# Altium schematic sheet 03_SoC_Power.SchDoc
size A3; SheetNumber: 13; SheetTotal: 21
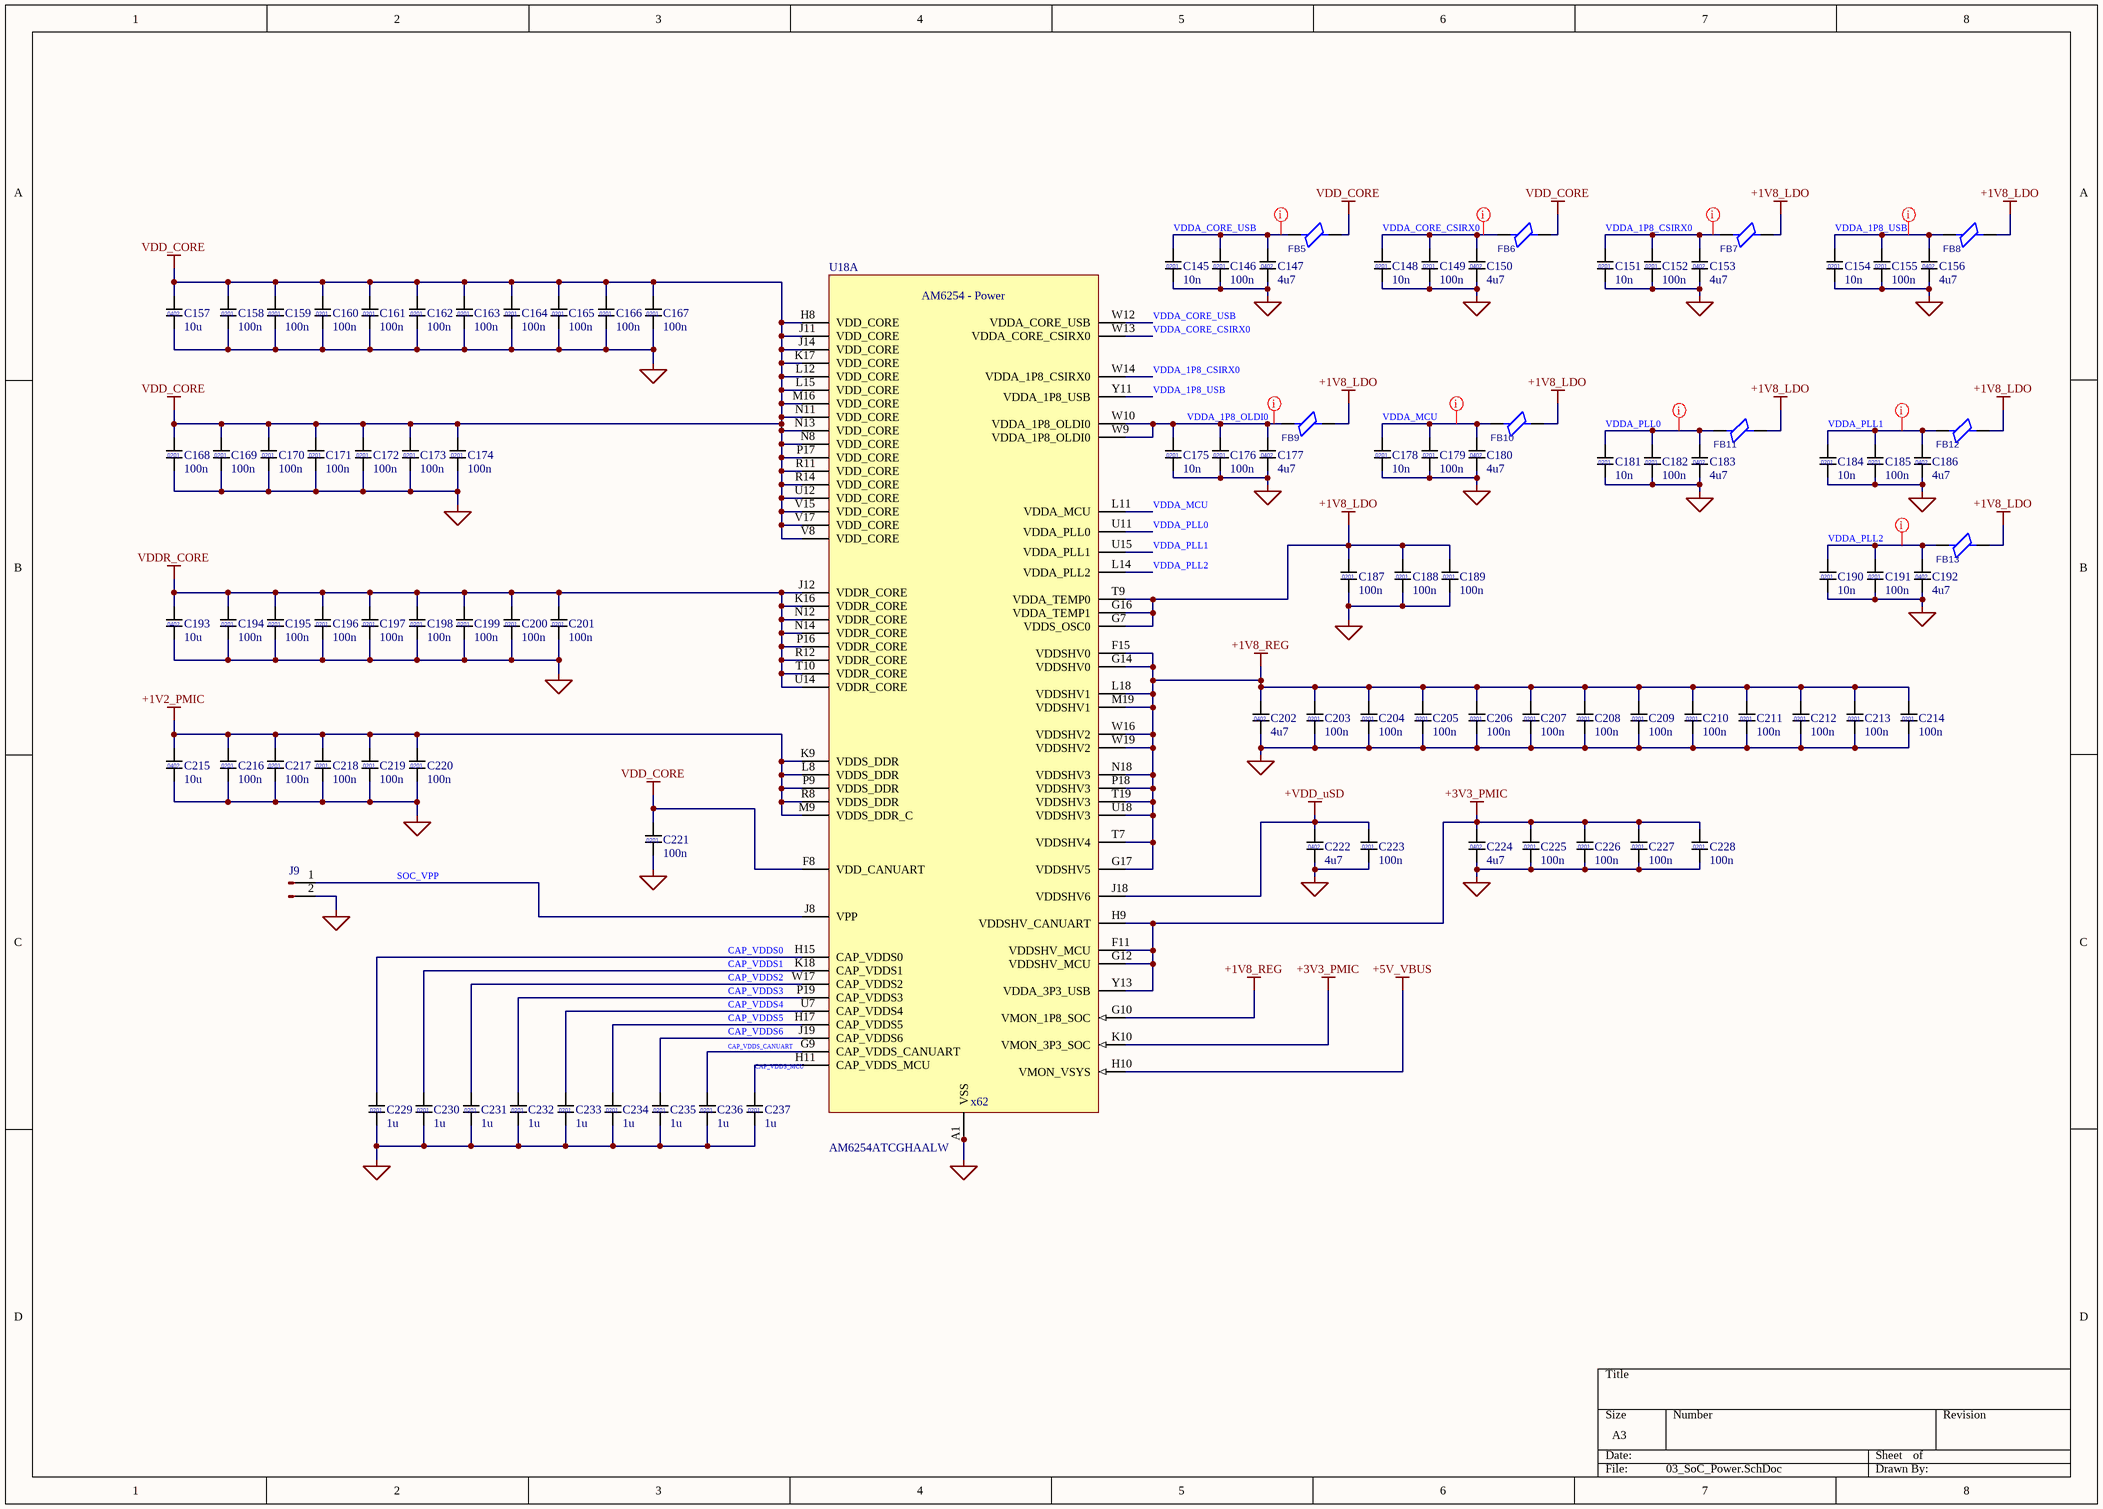
[diagram p0: 03_SoC_Power.SchDoc]

## Parts
C145  value 10n  [C0201]  (hidden comment: C_0201)
C146  value 100n  [C0201]  (hidden comment: C_0201)
C147  4u7  [C0402]
C148  value 10n  [C0201]  (hidden comment: C_0201)
C149  value 100n  [C0201]  (hidden comment: C_0201)
C150  4u7  [C0402]
C151  value 10n  [C0201]  (hidden comment: C_0201)
C152  value 100n  [C0201]  (hidden comment: C_0201)
C153  4u7  [C0402]
C154  value 10n  [C0201]  (hidden comment: C_0201)
C155  value 100n  [C0201]  (hidden comment: C_0201)
C156  4u7  [C0402]
C157  value 10u  [C0402]  (hidden comment: 4u7)
C158  value 100n  [C0201]  (hidden comment: C_0201)
C159  value 100n  [C0201]  (hidden comment: C_0201)
C160  value 100n  [C0201]  (hidden comment: C_0201)
C161  value 100n  [C0201]  (hidden comment: C_0201)
C162  value 100n  [C0201]  (hidden comment: C_0201)
C163  value 100n  [C0201]  (hidden comment: C_0201)
C164  value 100n  [C0201]  (hidden comment: C_0201)
C165  value 100n  [C0201]  (hidden comment: C_0201)
C166  value 100n  [C0201]  (hidden comment: C_0201)
C167  value 100n  [C0201]  (hidden comment: C_0201)
C168  value 100n  [C0201]  (hidden comment: C_0201)
C169  value 100n  [C0201]  (hidden comment: C_0201)
C170  value 100n  [C0201]  (hidden comment: C_0201)
C171  value 100n  [C0201]  (hidden comment: C_0201)
C172  value 100n  [C0201]  (hidden comment: C_0201)
C173  value 100n  [C0201]  (hidden comment: C_0201)
C174  value 100n  [C0201]  (hidden comment: C_0201)
C175  value 10n  [C0201]  (hidden comment: C_0201)
C176  value 100n  [C0201]  (hidden comment: C_0201)
C177  4u7  [C0402]
C178  value 10n  [C0201]  (hidden comment: C_0201)
C179  value 100n  [C0201]  (hidden comment: C_0201)
C180  4u7  [C0402]
C181  value 10n  [C0201]  (hidden comment: C_0201)
C182  value 100n  [C0201]  (hidden comment: C_0201)
C183  4u7  [C0402]
C184  value 10n  [C0201]  (hidden comment: C_0201)
C185  value 100n  [C0201]  (hidden comment: C_0201)
C186  4u7  [C0402]
C187  value 100n  [C0201]  (hidden comment: C_0201)
C188  value 100n  [C0201]  (hidden comment: C_0201)
C189  value 100n  [C0201]  (hidden comment: C_0201)
C190  value 10n  [C0201]  (hidden comment: C_0201)
C191  value 100n  [C0201]  (hidden comment: C_0201)
C192  4u7  [C0402]
C193  value 10u  [C0402]  (hidden comment: 4u7)
C194  value 100n  [C0201]  (hidden comment: C_0201)
C195  value 100n  [C0201]  (hidden comment: C_0201)
C196  value 100n  [C0201]  (hidden comment: C_0201)
C197  value 100n  [C0201]  (hidden comment: C_0201)
C198  value 100n  [C0201]  (hidden comment: C_0201)
C199  value 100n  [C0201]  (hidden comment: C_0201)
C200  value 100n  [C0201]  (hidden comment: C_0201)
C201  value 100n  [C0201]  (hidden comment: C_0201)
C202  4u7  [C0402]
C203  value 100n  [C0201]  (hidden comment: C_0201)
C204  value 100n  [C0201]  (hidden comment: C_0201)
C205  value 100n  [C0201]  (hidden comment: C_0201)
C206  value 100n  [C0201]  (hidden comment: C_0201)
C207  value 100n  [C0201]  (hidden comment: C_0201)
C208  value 100n  [C0201]  (hidden comment: C_0201)
C209  value 100n  [C0201]  (hidden comment: C_0201)
C210  value 100n  [C0201]  (hidden comment: C_0201)
C211  value 100n  [C0201]  (hidden comment: C_0201)
C212  value 100n  [C0201]  (hidden comment: C_0201)
C213  value 100n  [C0201]  (hidden comment: C_0201)
C214  value 100n  [C0201]  (hidden comment: C_0201)
C215  value 10u  [C0402]  (hidden comment: 4u7)
C216  value 100n  [C0201]  (hidden comment: C_0201)
C217  value 100n  [C0201]  (hidden comment: C_0201)
C218  value 100n  [C0201]  (hidden comment: C_0201)
C219  value 100n  [C0201]  (hidden comment: C_0201)
C220  value 100n  [C0201]  (hidden comment: C_0201)
C221  value 100n  [C0201]  (hidden comment: C_0201)
C222  4u7  [C0402]
C223  value 100n  [C0201]  (hidden comment: C_0201)
C224  4u7  [C0402]
C225  value 100n  [C0201]  (hidden comment: C_0201)
C226  value 100n  [C0201]  (hidden comment: C_0201)
C227  value 100n  [C0201]  (hidden comment: C_0201)
C228  value 100n  [C0201]  (hidden comment: C_0201)
C229  value 1u  [C0201]  (hidden comment: C_0201)
C230  value 1u  [C0201]  (hidden comment: C_0201)
C231  value 1u  [C0201]  (hidden comment: C_0201)
C232  value 1u  [C0201]  (hidden comment: C_0201)
C233  value 1u  [C0201]  (hidden comment: C_0201)
C234  value 1u  [C0201]  (hidden comment: C_0201)
C235  value 1u  [C0201]  (hidden comment: C_0201)
C236  value 1u  [C0201]  (hidden comment: C_0201)
C237  value 1u  [C0201]  (hidden comment: C_0201)
FB5  FB_0402  [FB0402]  (value not drawn)
FB6  FB_0402  [FB0402]  (value not drawn)
FB7  FB_0402  [FB0402]  (value not drawn)
FB8  FB_0402  [FB0402]  (value not drawn)
FB9  FB_0402  [FB0402]  (value not drawn)
FB10  FB_0402  [FB0402]  (value not drawn)
FB11  FB_0402  [FB0402]  (value not drawn)
FB12  FB_0402  [FB0402]  (value not drawn)
FB13  FB_0402  [FB0402]  (value not drawn)
J9  Conn_01x02_Pin  (value not drawn)
U18  AM6254ATCGHAALW  [AM6254ATCGHAALW]  (part A of 15)

## Nets
+1V2_PMIC: C215.1 C216.1 C217.1 C218.1 C219.1 C220.1 U18.K9(VDDS_DDR) U18.L8(VDDS_DDR) U18.M9(VDDS_DDR_C) U18.P9(VDDS_DDR) U18.R8(VDDS_DDR)
+1V8_LDO: C187.1 C188.1 C189.1 FB7.2 FB8.2 FB9.2 FB10.2 FB11.2 FB12.2 FB13.2 U18.G7(VDDS_OSC0) U18.G16(VDDA_TEMP1) U18.T9(VDDA_TEMP0)
+1V8_REG: C202.1 C203.1 C204.1 C205.1 C206.1 C207.1 C208.1 C209.1 C210.1 C211.1 C212.1 C213.1 C214.1 U18.F15(VDDSHV0) U18.G10(VMON_1P8_SOC) U18.G14(VDDSHV0) U18.G17(VDDSHV5) U18.L18(VDDSHV1) U18.M19(VDDSHV1) U18.N18(VDDSHV3) U18.P18(VDDSHV3) U18.T7(VDDSHV4) U18.T19(VDDSHV3) U18.U18(VDDSHV3) U18.W16(VDDSHV2) U18.W19(VDDSHV2)
+3V3_PMIC: C224.1 C225.1 C226.1 C227.1 C228.1 U18.F11(VDDSHV_MCU) U18.G12(VDDSHV_MCU) U18.H9(VDDSHV_CANUART) U18.K10(VMON_3P3_SOC) U18.Y13(VDDA_3P3_USB)
+5V_VBUS: U18.H10(VMON_VSYS)
+VDD_uSD: C222.1 C223.1 U18.J18(VDDSHV6)
GND: C145.2 C146.2 C147.2 C148.2 C149.2 C150.2 C151.2 C152.2 C153.2 C154.2 C155.2 C156.2 C157.2 C158.2 C159.2 C160.2 C161.2 C162.2 C163.2 C164.2 C165.2 C166.2 C167.2 C168.2 C169.2 C170.2 C171.2 C172.2 C173.2 C174.2 C175.2 C176.2 C177.2 C178.2 C179.2 C180.2 C181.2 C182.2 C183.2 C184.2 C185.2 C186.2 C187.2 C188.2 C189.2 C190.2 C191.2 C192.2 C193.2 C194.2 C195.2 C196.2 C197.2 C198.2 C199.2 C200.2 C201.2 C202.2 C203.2 C204.2 C205.2 C206.2 C207.2 C208.2 C209.2 C210.2 C211.2 C212.2 C213.2 C214.2 C215.2 C216.2 C217.2 C218.2 C219.2 C220.2 C221.2 C222.2 C223.2 C224.2 C225.2 C226.2 C227.2 C228.2 C229.2 C230.2 C231.2 C232.2 C233.2 C234.2 C235.2 C236.2 C237.2 J9.2(Pin_2) U18.A1(VSS) U18.A24(VSS) U18.A25(VSS) U18.AA11(VSS) U18.AB9(VSS) U18.AD1(VSS) U18.AD9(VSS) U18.AD12(VSS) U18.AD16(VSS) U18.AD25(VSS) U18.AE1(VSS) U18.AE8(VSS) U18.AE12(VSS) U18.AE16(VSS) U18.AE24(VSS) U18.AE25(VSS) U18.B25(VSS) U18.F13(VSS) U18.G13(VSS) U18.G19(VSS) U18.H13(VSS) U18.H16(VSS) U18.H18(VSS) U18.H20(VSS) U18.J7(VSS) U18.J13(VSS) U18.K7(VSS) U18.K13(VSS) U18.K15(VSS) U18.K19(VSS) U18.L20(VSS) U18.M7(VSS) U18.M8(VSS) U18.M10(VSS) U18.M12(VSS) U18.M13(VSS) U18.M17(VSS) U18.M18(VSS) U18.N15(VSS) U18.P7(VSS) U18.P10(VSS) U18.P13(VSS) U18.R13(VSS) U18.R15(VSS) U18.R18(VSS) U18.R20(VSS) U18.T8(VSS) U18.T13(VSS) U18.T14(VSS) U18.T16(VSS) U18.T17(VSS) U18.T18(VSS) U18.U8(VSS) U18.U19(VSS) U18.V9(VSS) U18.V10(VSS) U18.V11(VSS) U18.V13(VSS) U18.V16(VSS) U18.V18(VSS) U18.W7(VSS) U18.Y2(VSS)
VDD_CORE: C157.1 C158.1 C159.1 C160.1 C161.1 C162.1 C163.1 C164.1 C165.1 C166.1 C167.1 C168.1 C169.1 C170.1 C171.1 C172.1 C173.1 C174.1 C221.1 FB5.2 FB6.2 U18.F8(VDD_CANUART) U18.H8(VDD_CORE) U18.J11(VDD_CORE) U18.J14(VDD_CORE) U18.K17(VDD_CORE) U18.L12(VDD_CORE) U18.L15(VDD_CORE) U18.M16(VDD_CORE) U18.N8(VDD_CORE) U18.N11(VDD_CORE) U18.N13(VDD_CORE) U18.P17(VDD_CORE) U18.R11(VDD_CORE) U18.R14(VDD_CORE) U18.U12(VDD_CORE) U18.V8(VDD_CORE) U18.V15(VDD_CORE) U18.V17(VDD_CORE)
VDDR_CORE: C193.1 C194.1 C195.1 C196.1 C197.1 C198.1 C199.1 C200.1 C201.1 U18.J12(VDDR_CORE) U18.K16(VDDR_CORE) U18.N12(VDDR_CORE) U18.N14(VDDR_CORE) U18.P16(VDDR_CORE) U18.R12(VDDR_CORE) U18.T10(VDDR_CORE) U18.U14(VDDR_CORE)
CAP_VDDS0: C229.1 U18.H15(CAP_VDDS0)
CAP_VDDS1: C230.1 U18.K18(CAP_VDDS1)
CAP_VDDS2: C231.1 U18.W17(CAP_VDDS2)
CAP_VDDS3: C232.1 U18.P19(CAP_VDDS3)
CAP_VDDS4: C233.1 U18.U7(CAP_VDDS4)
CAP_VDDS5: C234.1 U18.H17(CAP_VDDS5)
CAP_VDDS6: C235.1 U18.J19(CAP_VDDS6)
CAP_VDDS_CANUART: C236.1 U18.G9(CAP_VDDS_CANUART)
CAP_VDDS_MCU: C237.1 U18.H11(CAP_VDDS_MCU)
SOC_VPP: J9.1(Pin_1) U18.J8(VPP)
VDDA_1P8_CSIRX0: C151.1 C152.1 C153.1 FB7.1 U18.W14(VDDA_1P8_CSIRX0)
VDDA_1P8_OLDI0: C175.1 C176.1 C177.1 FB9.1 U18.W9(VDDA_1P8_OLDI0) U18.W10(VDDA_1P8_OLDI0)
VDDA_1P8_USB: C154.1 C155.1 C156.1 FB8.1 U18.Y11(VDDA_1P8_USB)
VDDA_CORE_CSIRX0: C148.1 C149.1 C150.1 FB6.1 U18.W13(VDDA_CORE_CSIRX0)
VDDA_CORE_USB: C145.1 C146.1 C147.1 FB5.1 U18.W12(VDDA_CORE_USB)
VDDA_MCU: C178.1 C179.1 C180.1 FB10.1 U18.L11(VDDA_MCU)
VDDA_PLL0: C181.1 C182.1 C183.1 FB11.1 U18.U11(VDDA_PLL0)
VDDA_PLL1: C184.1 C185.1 C186.1 FB12.1 U18.U15(VDDA_PLL1)
VDDA_PLL2: C190.1 C191.1 C192.1 FB13.1 U18.L14(VDDA_PLL2)

## Layout directives
net class PWR: VDDA_1P8_CSIRX0, VDDA_1P8_OLDI0, VDDA_1P8_USB, VDDA_CORE_CSIRX0, VDDA_CORE_USB, VDDA_MCU, VDDA_PLL0, VDDA_PLL1, VDDA_PLL2

## Notes on the sheet
- (in symbol AM6254ATCGHAALW, part A) AM6254 - Power; x62
- (in symbol C_0201) 0201
- (in symbol C_0402) 0402

## Library data of the parts
C145 C146 C148 C149 C151 C152 C154 C155 C158-C176 C178 C179 C181 C182 C184 C185 C187-C191 C194-C201 C203-C214 C216-C221 C223 C225-C237 = C_0201: MLCC 0201; Manufacturer_Name: *; Manufacturer_Part_Number: *
C147 C150 C153 C156 C157 C177 C180 C183 C186 C192 C193 C202 C215 C222 C224 = C_0402: MLCC 0402; Manufacturer_Name: *; Manufacturer_Part_Number: *
  C147 C150 C153 C156 C177 C180 C183 C186 C192 C202 C222 C224: Value: 4u7
FB5-FB13 = FB_0402: Ferrite bead; Parameter 1: *
J9 = Conn_01x02_Pin: Generic connector, single row, 01x02, script generated
U18 = AM6254ATCGHAALW: TI AM6254, quad Cortex-A53 SoC, ALW 425-ball FCCSP 13x13mm 0.5mm pitch; separate interface and power units; Pinmux_Note: Each physical ball occurs once under its primary interface. See companion pinmux CSV for alternate functions. Multiplexable digital pads use bidirectional ERC type.; KiCad_Footprint: SamacSys_Parts:BGA425C50P25X25_1300X1300X89; MPN: AM6254ATCGHAALW; Footprint_Note: Unassigned: requires verified ALW0425 425-ball FCCSP, 13x13mm, 0.5mm pitch; do not substitute a fully populated BGA.; Datasheet: https://www.ti.com/lit/ds/symlink/am625.pdf; ComponentLink1Description: Datasheet; ComponentLink1URL: https://www.ti.com/lit/ds/symlink/am625.pdf